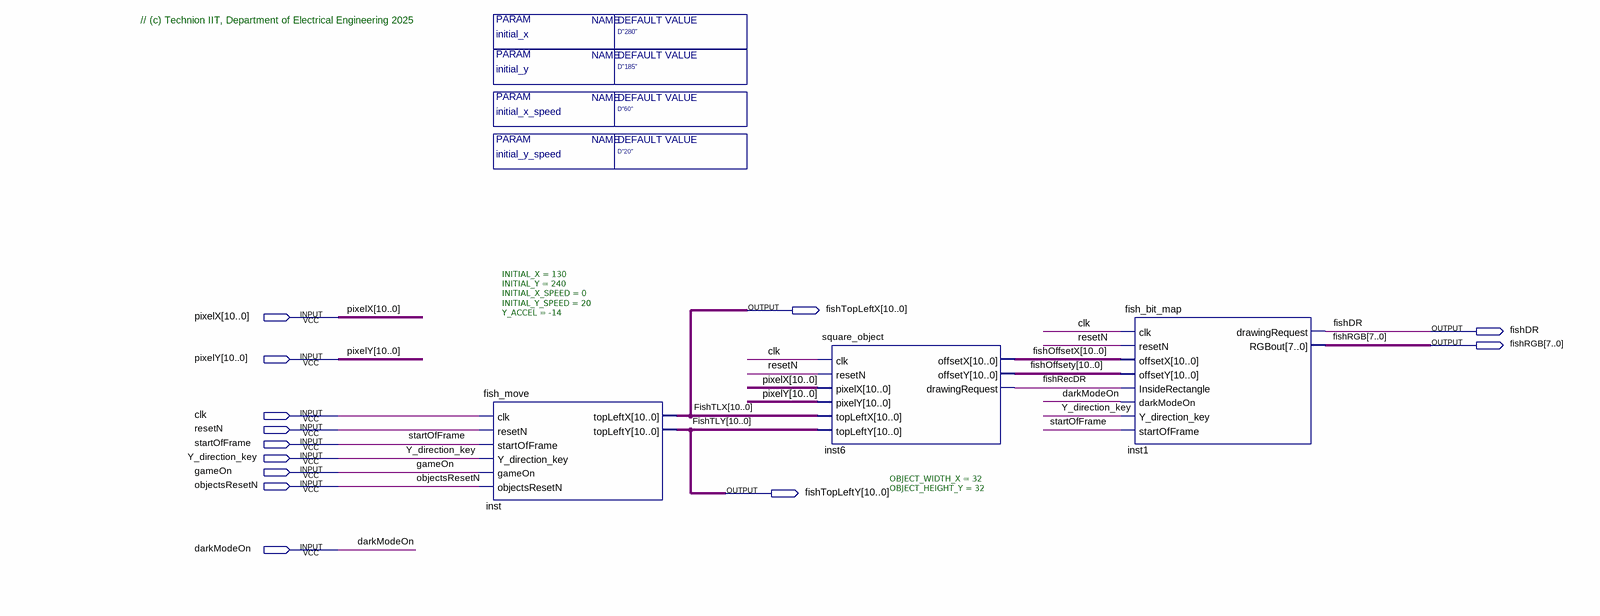
[diagram p0: schematic sheet]
// Quartus schematic Fish_Block_T.bdf as structural Verilog: 3 symbols, 13 pins
module Fish_Block_T #(parameter initial_x = "D\"280\"", parameter initial_y = "D\"185\"", parameter initial_x_speed = "D\"60\"", parameter initial_y_speed = "D\"20\"") (
  input  [10:0] pixelX,
  input  [10:0] pixelY,
  input  clk,
  input  resetN,
  input  startOfFrame,
  input  Y_direction_key,
  input  gameOn,
  input  objectsResetN,
  input  darkModeOn,
  output [10:0] fishTopLeftX,
  output fishDR,
  output [7:0] fishRGB,
  output [10:0] fishTopLeftY
);

  wire fishRecDR;
  wire [10:0] fishOffsetX, fishOffsety;

  fish_move #(.INITIAL_X(130), .INITIAL_Y(240), .INITIAL_X_SPEED(0), .INITIAL_Y_SPEED(20), .Y_ACCEL(-14)) inst (
    .clk(clk), .resetN(resetN), .startOfFrame(startOfFrame), .Y_direction_key(Y_direction_key),
    .gameOn(gameOn), .objectsResetN(objectsResetN), .topLeftX(fishTopLeftX), .topLeftY(fishTopLeftY));
  square_object #(.OBJECT_WIDTH_X(32), .OBJECT_HEIGHT_Y(32)) inst6 (
    .clk(clk), .resetN(resetN), .pixelX(pixelX), .pixelY(pixelY), .topLeftX(fishTopLeftX),
    .topLeftY(fishTopLeftY), .offsetX(fishOffsetX), .offsetY(fishOffsety), .drawingRequest(fishRecDR));
  fish_bit_map inst1 (
    .clk(clk), .resetN(resetN), .offsetX(fishOffsetX), .offsetY(fishOffsety), .InsideRectangle(fishRecDR),
    .darkModeOn(darkModeOn), .Y_direction_key(Y_direction_key), .startOfFrame(startOfFrame),
    .drawingRequest(fishDR), .RGBout(fishRGB));

  // Other names for the same wires on the sheet: FishTLX[10:0] = fishTopLeftX; FishTLY[10:0] = fishTopLeftY

  // Notes on the sheet:
  //   // (c) Technion IIT, Department of Electrical Engineering 2025
endmodule
